# Altium schematic sheet CAN.SchDoc
size A4
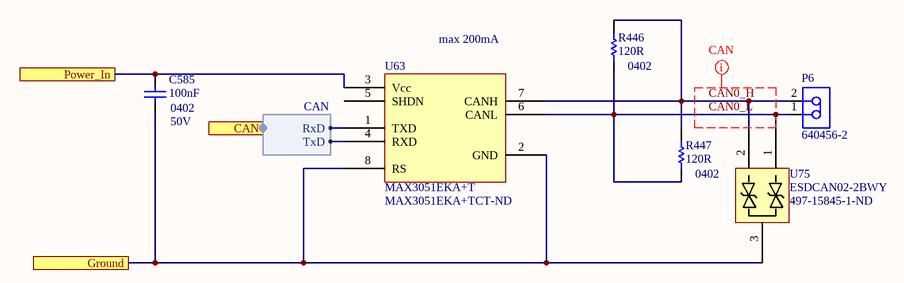
[diagram p0: CAN.SchDoc]

## Parts
C585  100nF  Case Code (Imperial): 0402  Voltage: 50V  [CAP 0402/1005 KK]
P6  640456-2  [TECO-640456-2_V]
R446  120R  Case/Package: 0402  [RES 0402/1005 RF KK]
R447  120R  Case/Package: 0402  [RES 0402/1005 RF KK]
U63  MAX3051EKA+T  Supplier Part Number 1: MAX3051EKA+TCT-ND  [MAX3051EKA+T SOT23]
U75  ESDCAN02-2BWY  Supplier Part Number 1: 497-15845-1-ND  [ESDCAN02-2BWY]

## Ports
CAN (harness CAN), Ground, Power_In

## Harnesses
CAN: RxD, TxD

## Nets
CAN0_H: P6.2 R446.2 R447.2 U63.7(CANH) U75.2
CAN0_L: P6.1 R446.1 R447.1 U63.6(CANL) U75.1
Ground: C585.1 U63.2(GND) U63.8(RS) U75.3 ; port Ground
Power_In: C585.2 U63.3(Vcc) ; port Power_In
NetU63_1: U63.1(TXD) ; port CAN.RxD
NetU63_4: U63.4(RXD) ; port CAN.TxD

Not connected (* = marked no-connect by the designer): U63 5(SHDN)

## Layout directives
net class CAN: CAN0_H, CAN0_L

## Notes on the sheet
- (near U63) max 200mA
- Title
- Size:
- Date:
- A3
- Number:
- Time:
- Revision:
- Sheet
- of
- File:

## Library data of the parts
C585 = Capacitor: CAP CER 0.1UF 50V X5R 0402; Manufacturer: Murata; Manufacturer Part Number: GRM155R61H104KE14D; Dielectric Material: Ceramic; Dissipation Factor: 0.025%; Tolerance: 10%; Supplier 1: Digi-Key; Supplier Part Number 1: 490-10697-1-ND; RoHS: Yes; Category: Ceramic Capacitors; Stock 1: 435607; Pricing 1: 1=0,10000, 10=0,04600, 100=0,02050, 500=0,01464, 1000=0,01150, 2500=0,01045, 5000=0,00961 (USD); Mount: Surface Mount; Case/Package: 0402; Weight: 0.000212oz; Case Code (Metric): 1005; Min Operating Temperature: -55°C; Max Operating Temperature: 85°C; Capacitance: 100nF; Packaging: Tape and Reel; Voltage Rating: 50V; Dielectric: X5R; Termination: SMD/SMT; Composition: Ceramic; Voltage Rating (DC): 50V; Package Quantity: 10000; Length: 1mm; Height: 0.5mm; Width: 0.02inch; Thickness: 0.022inch; Depth: 0.5mm; REACH SVHC: No SVHC; Lead Free: Lead Free; ComponentLink1URL: http://www.farnell.com/datasheets/2079150.pdf?src-supplier=Farnell; ComponentLink1Description: http://www.farnell.com/datasheets/2079150.pdf?src-supplier=Farnell; ComponentLink2URL: http://www.mouser.com/ds/2/281/c02e-2905.pdf?src-supplier=Mouser; ComponentLink2Description: http://www.mouser.com/ds/2/281/c02e-2905.pdf?src-supplier=Mouser; ComponentLink3URL: http://www.farnell.com/datasheets/2079150.pdf?src-supplier=Element14; ComponentLink3Description: http://www.farnell.com/datasheets/2079150.pdf?src-supplier=Element14; ComponentLink4URL: http://search.murata.co.jp/Ceramy/image/img/A01X/G101/ENG/GRM155R61H104KE14-01.pdf?src-supplier=Digi-Key; ComponentLink4Description: http://search.murata.co.jp/Ceramy/image/img/A01X/G101/ENG/GRM155R61H104KE14-01.pdf?src-supplier=Digi-Key
P6 = 640456-2: Male Header, Pitch 2.54 mm, 1 x 2 Position, Height 10.49 mm, Tail Length 3.556 mm, -55 to 105 degC, RoHS, Bulk; Mounting Hole Size: 0.04 / "; Number of Contacts: 2; Primary Type: Interconnect System; Temperature, Operating: -55 to +105 / °C; Pin Spacing: 0.1 / "; Color, Housing: White; Connector Type: MTA-100; Mount Angle: Vertical; Voltage, Rating: 250 / V; Material, Housing: Polyester; Material, Contact: Copper Alloy; Special Features: Pinstrip; Brand/Series: MTA-100 Series; Contact Centerline Spacing: 0.100 / in.; Contact Termination Area Plating: Tin; Agency Approvals: CSA, UL; Angle: Straight; Standards: RoHS Compliant, ELV Compliant, UL 94V-0; Current, Rating: 5 / A; DatasheetVersion: Rev. W; PackageReference: THD; PackageDescription: HDR, 2-Leads, Body 5.715x5.08mm, Pitch 2.54mm; Supplier 1: Digi-Key; Supplier Part Number 1: A1921-ND; Length, Terminal Post: 0.14 / in.; Contact Mating Area Plating: Tin; Color: White; Length, Pin: 0.14 / "; Termination: Solder; Number of Positions: 2; Length, Overall: 0.2 / "; Contact Shape: Square; Contact Plating: Tin; Mounting Type: PC Mount; Type: PCB Plug; Flammability Rating: UL94V-0; Number of Rows: 1; Size, Post: 0.025 / in.; ComponentLink1Description: Manufacturer URL; ComponentLink1URL: http://www.te.com; ComponentLink2Description: Datasheet; ComponentLink2URL: https://datasheet.ciiva.com/11746/0900766b80eb7fdd-11746365.pdf
R446 R447 = Resistor: RES SMD 120 OHM 1% 1/16W 0402; Manufacturer: Vishay; Manufacturer Part Number: CRCW0402120RFKED; Temperature Coefficient: 100ppm/°C; Power Rating: 63mW; Voltage Rating: 50V; Supplier 1: Digi-Key; Supplier Part Number 1: 541-120LCT-ND; RoHS: Yes; Category: Chip SMD Resistors; Stock 1: 140153; Pricing 1: 1=0,10000, 10=0,03600, 100=0,01460, 1000=0,00657, 2500=0,00570, 5000=0,00471 (USD); Mount: Surface Mount; Weight: 2.3E-05oz; Case Code (Metric): 1005; Case Code (Imperial): 0402; Contact Plating: Tin; Min Operating Temperature: -55°C; Max Operating Temperature: 155°C; Composition: Thick Film; Resistance: 120R; Tolerance: 1%; Packaging: Tape and Reel; Number of Terminations: 2; Termination: SMD/SMT; Military Standard: Not; Package Quantity: 10000; Max Power Dissipation: 63mW; Voltage Rating (DC): 50V; Features: Automotive AEC-Q200; Working Voltage: 50V; Length: 1mm; Height: 0.35mm; Width: 0.02inch; Depth: 0.5mm; Radiation Hardening: No; Lead Free: Lead Free; REACH SVHC: Unknown; ComponentLink1URL: https://datasheet.ciiva.com/11817/0900766b80d98824-11817989.pdf?src-supplier=RSComponents; ComponentLink1Description: https://datasheet.ciiva.com/11817/0900766b80d98824-11817989.pdf?src-supplier=RSComponents; ComponentLink2URL: https://datasheet.ciiva.com/2463/dcrcwe3-2463109.pdf?src-supplier=Digi-Key; ComponentLink2Description: https://datasheet.ciiva.com/2463/dcrcwe3-2463109.pdf?src-supplier=Digi-Key; ComponentLink3URL: https://datasheet.ciiva.com/8336/dcrcwe3-8336661.pdf?src-supplier=Avnet; ComponentLink3Description: https://datasheet.ciiva.com/8336/dcrcwe3-8336661.pdf?src-supplier=Avnet; ComponentLink4URL: https://datasheet.ciiva.com/2463/dcrcwe3-2463110.pdf?src-supplier=Digi-Key; ComponentLink4Description: https://datasheet.ciiva.com/2463/dcrcwe3-2463110.pdf?src-supplier=Digi-Key; ComponentLink5URL: https://datasheet.ciiva.com/5550/dcrcwe3-109170-5550502.pdf?src-supplier=Mouser; ComponentLink5Description: https://datasheet.ciiva.com/5550/dcrcwe3-109170-5550502.pdf?src-supplier=Mouser; ComponentLink6URL: https://datasheet.ciiva.com/2463/dcrcwe3-2463111.pdf?src-supplier=Digi-Key; ComponentLink6Description: https://datasheet.ciiva.com/2463/dcrcwe3-2463111.pdf?src-supplier=Digi-Key; ComponentLink7URL: https://datasheet.ciiva.com/3256/dcrcwe3-3256009.pdf?src-supplier=Avnet; ComponentLink7Description: https://datasheet.ciiva.com/3256/dcrcwe3-3256009.pdf?src-supplier=Avnet; ComponentLink8URL: https://datasheet.ciiva.com/7777/1697337-7777194.pdf?src-supplier=Element14; ComponentLink8Description: https://datasheet.ciiva.com/7777/1697337-7777194.pdf?src-supplier=Element14; ComponentLink9URL: https://datasheet.ciiva.com/7777/1697337-7777195.pdf?src-supplier=Element14; ComponentLink9Description: https://datasheet.ciiva.com/7777/1697337-7777195.pdf?src-supplier=Element14; ComponentLink10URL: https://datasheet.ciiva.com/16881/dcrcwe3-16881548.pdf?src-supplier=Avnet+Europe; ComponentLink10Description: https://datasheet.ciiva.com/16881/dcrcwe3-16881548.pdf?src-supplier=Avnet+Europe; ComponentLink11URL: https://datasheet.ciiva.com/16199/dcrcwe3-16199070.pdf?src-supplier=Future+Electronics; ComponentLink11Description: https://datasheet.ciiva.com/16199/dcrcwe3-16199070.pdf?src-supplier=Future+Electronics; ComponentLink12URL: https://datasheet.ciiva.com/22674/1912744-22674687.pdf?src-supplier=Element14; ComponentLink12Description: https://datasheet.ciiva.com/22674/1912744-22674687.pdf?src-supplier=Element14
U63 = MAX3051EKA+T: IC TXRX CAN 1MBPS SOT23-8; Manufacturer: Maxim; Max Supply Voltage: 3.465V; Min Supply Voltage: 3.135V; Operating Supply Current: 35mA; Number of Transceivers: 1; Max Supply Current: 70mA; Operating Supply Voltage: 3.3V; Supplier 1: Digi-Key; Manufacturer Part Number: MAX3051EKA+T; RoHS: Yes; Category: Interface ICs; Stock 1: 2708; Pricing 1: 1=2,27000, 10=2,04000, 25=1,92800, 100=1,58540, 250=1,58208 (USD); Mount: Surface Mount; Case/Package: SOT-23-8; Number of Pins: 8; Weight: 0.01787oz; Contact Plating: Tin,Matte; Min Operating Temperature: -40°C; Max Operating Temperature: 85°C; Packaging: Tape and Reel; Data Rate: 1Mbps; Package Quantity: 1; Interface: CAN; Number of Transmit Buffers: 1; Number of Receive Buffers: 1; Length: 2.9mm; Height: 1.25mm; Width: 1.625mm; Radiation Hardening: No; REACH SVHC: Unknown; ComponentLink1URL: https://datasheet.ciiva.com/1711/max3051-1711845.pdf?src-supplier=Digi-Key; ComponentLink1Description: https://datasheet.ciiva.com/1711/max3051-1711845.pdf?src-supplier=Digi-Key; ComponentLink2URL: https://datasheet.ciiva.com/1711/max3051-1711846.pdf?src-supplier=Digi-Key; ComponentLink2Description: https://datasheet.ciiva.com/1711/max3051-1711846.pdf?src-supplier=Digi-Key; ComponentLink3URL: https://datasheet.ciiva.com/1711/max3051-1711847.pdf?src-supplier=Digi-Key; ComponentLink3Description: https://datasheet.ciiva.com/1711/max3051-1711847.pdf?src-supplier=Digi-Key; ComponentLink4URL: https://datasheet.ciiva.com/16639/max3051-16639464.pdf?src-supplier=Avnet+Europe; ComponentLink4Description: https://datasheet.ciiva.com/16639/max3051-16639464.pdf?src-supplier=Avnet+Europe; ComponentLink5URL: https://datasheet.ciiva.com/12072/max3051-74908-12072588.pdf?src-supplier=Mouser; ComponentLink5Description: https://datasheet.ciiva.com/12072/max3051-74908-12072588.pdf?src-supplier=Mouser
U75 = ESDCAN02-2BWY: TVS DIODE 26.5VWM 44VC SOT323; Manufacturer: STMicroelectronics; Peak Pulse Current: 3A; Number of Bidirectional Channels: 2; Reverse Standoff Voltage: 26.5V; Min Breakdown Voltage: 28.5V; Clamping Voltage: 44V; Peak Pulse Power: 250W; Power Line Protection: No; Supplier 1: Digi-Key; Manufacturer Part Number: ESDCAN02-2BWY; Stock 1: 3018; Pricing 1: 1 = 0,43000, 10 = 0,32700, 25 = 0,29440, 100 = 0,15530, 250 = 0,15372, 500 = 0,13764, 1000 = 0,10712 (USD); RoHS: Yes; Mount: Surface Mount; Case/Package: SOT-323-3; Min Operating Temperature: -55°C; Max Operating Temperature: 175°C; Composition: Zener; Packaging: Cut Tape; ComponentLink1URL: http://www.mouser.com/ds/2/389/esdcan02-2bwy-954689.pdf?src-supplier=Mouser; ComponentLink1Description: http://www.mouser.com/ds/2/389/esdcan02-2bwy-954689.pdf?src-supplier=Mouser; ComponentLink2URL: https://www.st.com/resource/en/datasheet/esdcan06-2bwy.pdf?src-supplier=Digi-Key; ComponentLink2Description: https://www.st.com/resource/en/datasheet/esdcan06-2bwy.pdf?src-supplier=Digi-Key; ComponentLink3URL: http://www.st.com/content/ccc/resource/sales_and_marketing/promotional_material/selection_guide/fa/8a/bd/fb/a8/06/42/00/sgdiodeauto.pdf/files/sgdiodeauto.pdf/jcr:content/translations/en.sgdiodeauto.pdf?src-supplier=Digi-Key; ComponentLink3Description: http://www.st.com/content/ccc/resource/sales_and_marketing/promotional_material/selection_guide/fa/8a/bd/fb/a8/06/42/00/sgdiodeauto.pdf/files/sgdiodeauto.pdf/jcr:content/translations/en.sgdiodeauto.pdf?src-supplier=Digi-Key